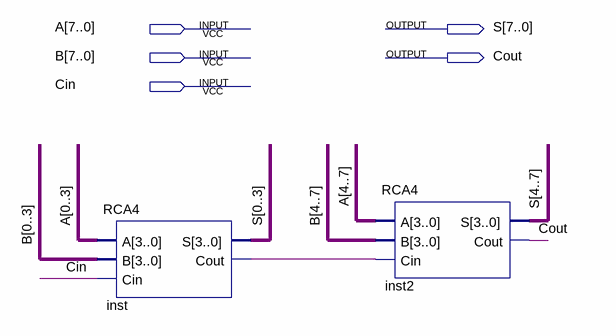
[diagram p0: schematic sheet]
// Quartus schematic RCA8.bdf as structural Verilog: 2 symbols, 5 pins
module RCA8 (
  input  [7:0] A,
  input  [7:0] B,
  input  Cin,
  output [7:0] S,
  output Cout
);

  wire inst_cout;

  RCA4 inst (
    .A({A[0], A[1], A[2], A[3]}), .B({B[0], B[1], B[2], B[3]}), .Cin(Cin), .S({S[0], S[1], S[2], S[3]}),
    .Cout(inst_cout));
  RCA4 inst2 (
    .A({A[4], A[5], A[6], A[7]}), .B({B[4], B[5], B[6], B[7]}), .Cin(inst_cout),
    .S({S[4], S[5], S[6], S[7]}), .Cout(Cout));
endmodule
